# Altium project Gear Trak.PrjPcb
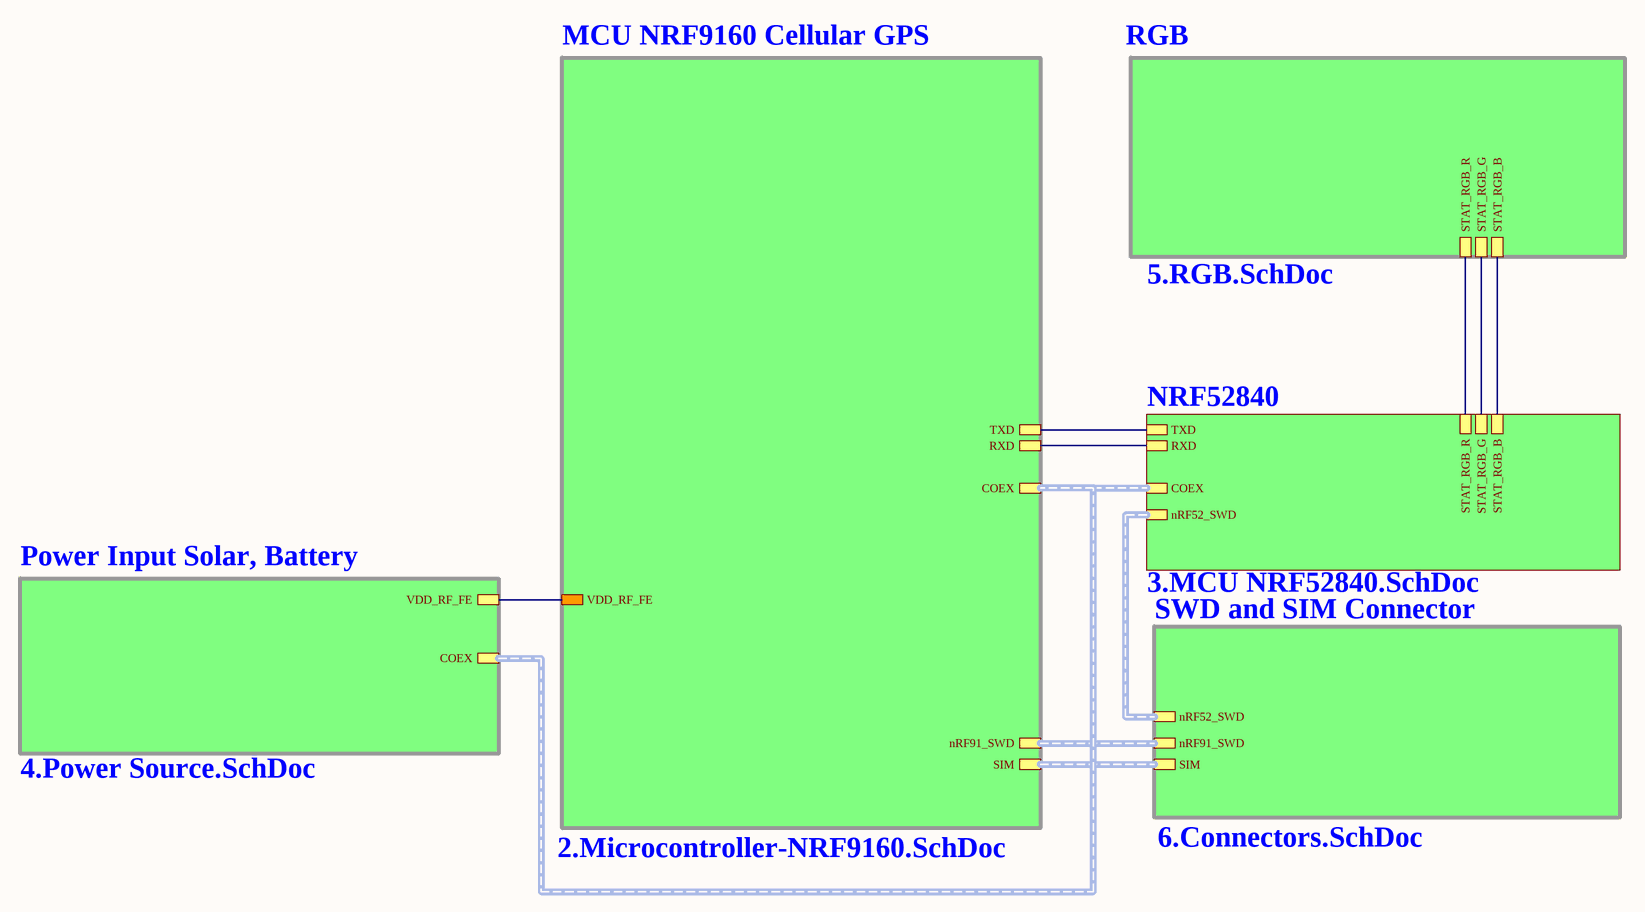
[diagram p0: 1.Block Diagram.SchDoc]
6 sheets, 130 parts. Net scope: hierarchical (ports join the sheet entries above them; power ports are global).
Board file: PCB.PcbDoc
Sheets:
  1.Block Diagram.SchDoc
    MCU NRF9160 Cellular GPS = 2.Microcontroller-NRF9160.SchDoc
    RGB = 5.RGB.SchDoc
    Power Input Solar, Battery = 4.Power Source.SchDoc
    SWD and SIM Connector = 6.Connectors.SchDoc
    NRF52840 = 3.MCU NRF52840.SchDoc

## Sheet 1.Block Diagram.SchDoc
size A3; DocumentNumber: 1; SheetNumber: 1

### Sub-sheets
MCU NRF9160 Cellular GPS = 2.Microcontroller-NRF9160.SchDoc: nRF91_SWD (harness SWD), SIM (harness SIM), VDD_RF_FE, COEX (harness COEX), TXD, RXD
NRF52840 = 3.MCU NRF52840.SchDoc: COEX (harness COEX), nRF52_SWD (harness SWD), STAT_RGB_R, STAT_RGB_G, STAT_RGB_B, TXD, RXD
Power Input Solar, Battery = 4.Power Source.SchDoc: COEX (harness COEX), VDD_RF_FE
RGB = 5.RGB.SchDoc: STAT_RGB_R, STAT_RGB_B, STAT_RGB_G
SWD and SIM Connector = 6.Connectors.SchDoc: SIM (harness SIM), nRF91_SWD (harness SWD), nRF52_SWD (harness SWD)

### Nets
RXD: sheet MCU NRF9160 Cellular GPS/RXD, sheet NRF52840/RXD
STAT_RGB_B: sheet RGB/STAT_RGB_B, sheet NRF52840/STAT_RGB_B
STAT_RGB_G: sheet RGB/STAT_RGB_G, sheet NRF52840/STAT_RGB_G
STAT_RGB_R: sheet RGB/STAT_RGB_R, sheet NRF52840/STAT_RGB_R
TXD: sheet MCU NRF9160 Cellular GPS/TXD, sheet NRF52840/TXD
VDD_RF_FE: sheet MCU NRF9160 Cellular GPS/VDD_RF_FE, sheet Power Input Solar, Battery/VDD_RF_FE

### Buses and harness runs
harness sheet MCU NRF9160 Cellular GPS/COEX = sheet NRF52840/COEX = sheet Power Input Solar, Battery/COEX
harness sheet MCU NRF9160 Cellular GPS/nRF91_SWD = sheet SWD and SIM Connector/nRF91_SWD
harness sheet MCU NRF9160 Cellular GPS/SIM = sheet SWD and SIM Connector/SIM
harness sheet NRF52840/nRF52_SWD = sheet SWD and SIM Connector/nRF52_SWD

## Sheet 2.Microcontroller-NRF9160.SchDoc
size A2; DocumentNumber: 2; SheetNumber: 2
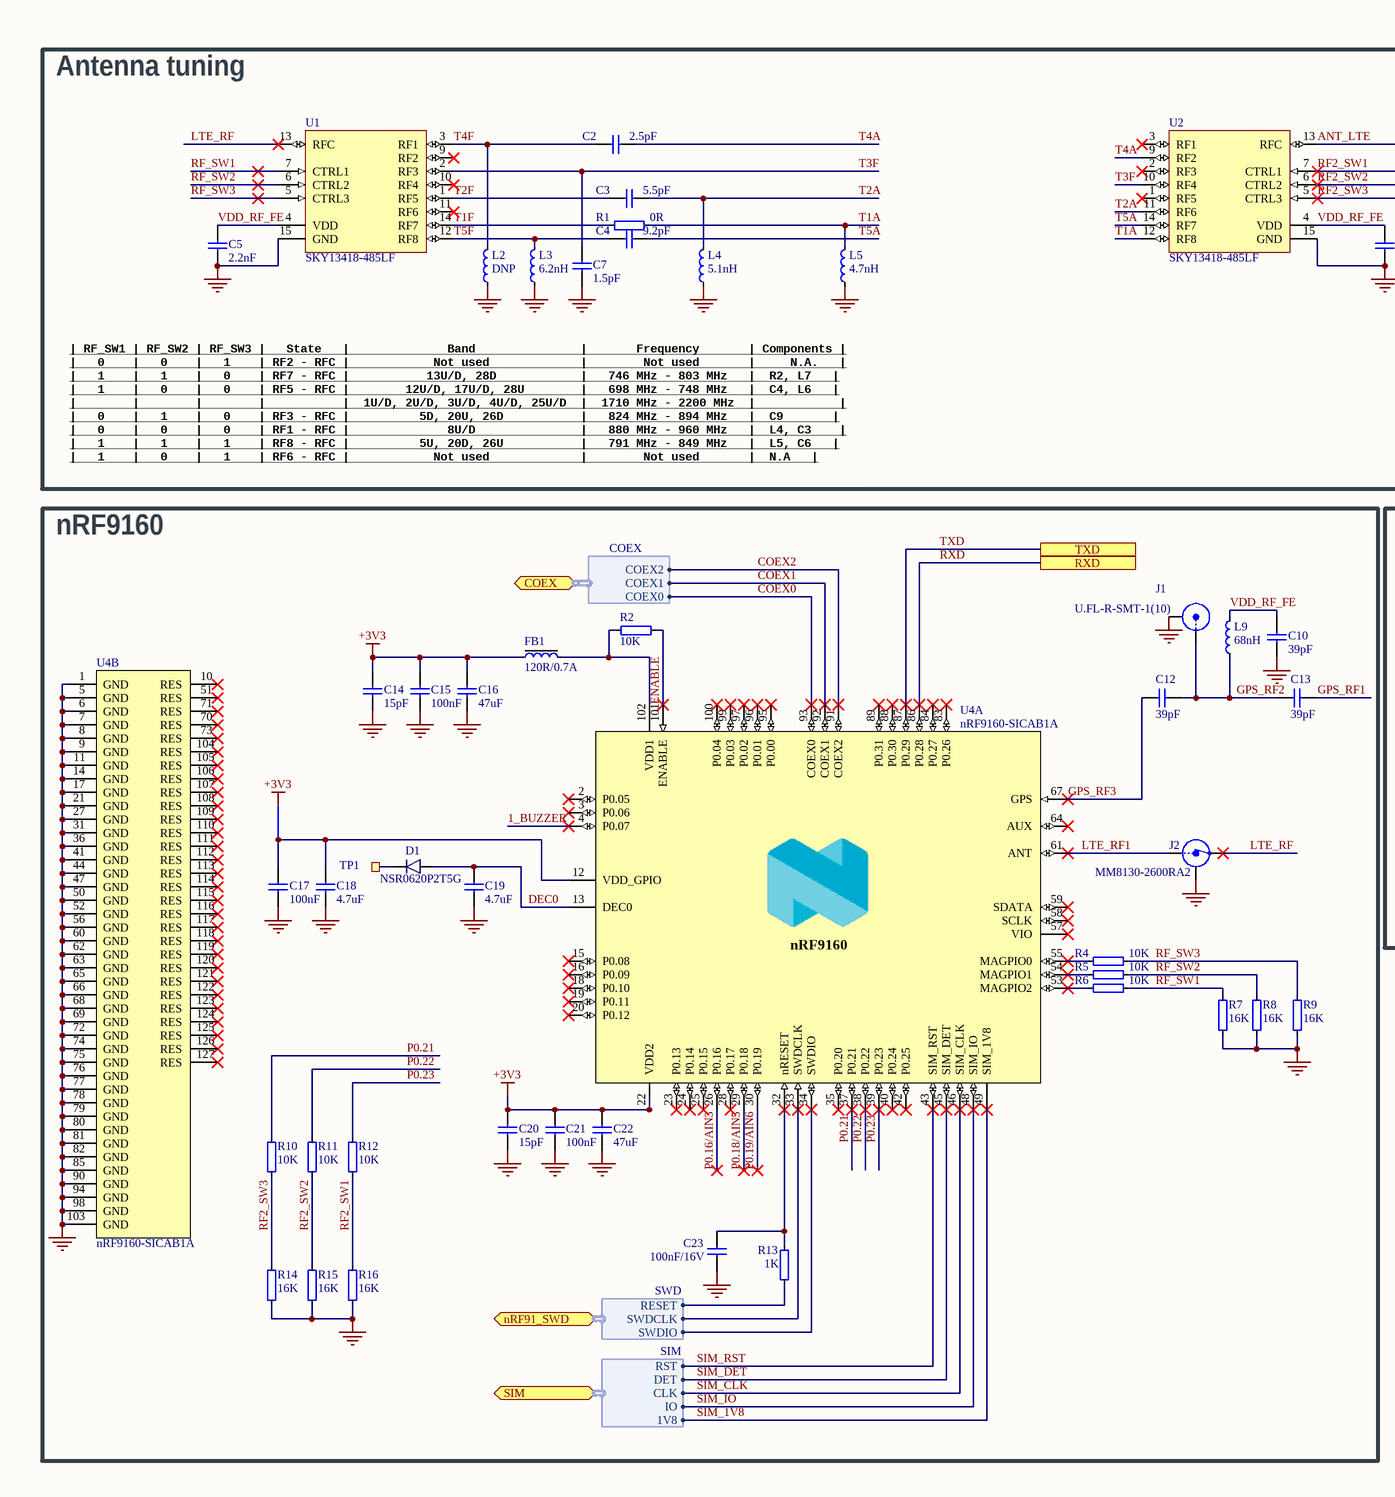
[diagram p1: 2.Microcontroller-NRF9160.SchDoc, left]
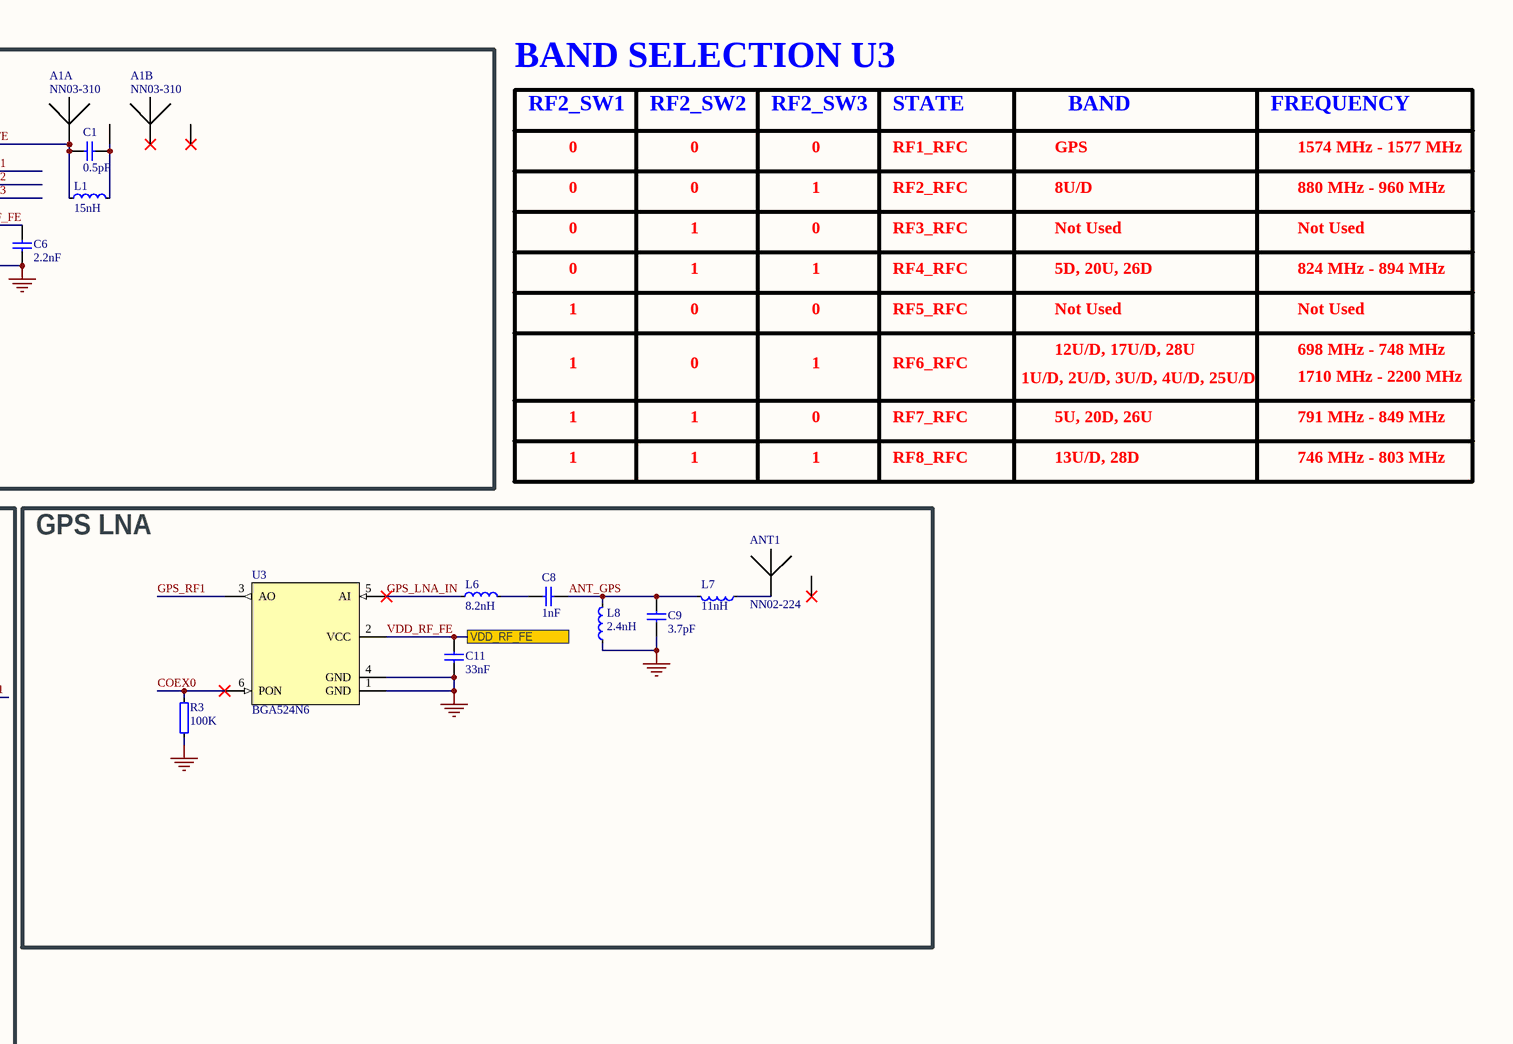
[diagram p2: 2.Microcontroller-NRF9160.SchDoc, right]

### Parts
A1  NN03-310  [FR01-S4-210_DF]  (parts A,B of 2)
ANT1  NN02-224  [ANT-NN02-224]
C1  0.5pF  [CAPC1005X04L]
C2  2.5pF  [CAPC0603X03L_C]
C3  5.5pF  [CAPC0603X03L_C]
C4  9.2pF  [CAPC0603X03L_C]
C5  2.2nF  [CAPC1005X04L]
C6  2.2nF  [CAPC1005X04L]
C7  1.5pF  [CAPC0603X03L_C]
C8  1nF  [CAPC1005X04L]
C9  3.7pF  [CAPC1005X04L]
C10  39pF  [CAPC1608X06L_3]
C11  33nF  [CAPC1005X04L]
C12  39pF  [CAPC1608X06L_3]
C13  39pF  [CAPC1608X06L_3]
C14  15pF  [CAPC1608X06L_3]
C15  100nF  [CAPC1608X06L_3]
C16  47uF  [CAPC2012X11L]
C17  100nF  [CAPC1608X06L_3]
C18  4.7uF  [CAPC1608X06L_3]
C19  4.7uF  [CAPC1608X06L_3]
C20  15pF  [CAPC1608X06L_3]
C21  100nF  [CAPC1608X06L_3]
C22  47uF  [CAPC2012X11L]
C23  100nF/16V  [CAPC1005X04L]
D1  NSR0620P2T5G  [SODFL100X40-2N]
FB1  120R/0.7A  [INDC1005X04L]
J1  U.FL-R-SMT-1(10)  [COAXIAL RF U.FL-R-SMT-1]
J2  MM8130-2600RA2  [COAXIAL-SWF]
L1  15nH  [INDC1608X06L_WW]
L2  DNP  [INDC0603X03L_C]
L3  6.2nH  [INDC0603X03L_C]
L4  5.1nH  [INDC0603X03L_C]
L5  4.7nH  [INDC0603X03L_C]
L6  8.2nH  [INDC1608X06L_WW]
L7  11nH  [INDC1608X06L]
L8  2.4nH  [INDC1005X04L_2]
L9  68nH  [INDC1005X04L_WW]
R1  0R  [RESC0603X03L_C]
R2  10K  [RESC1005X04L]
R3  100K  [RESC1005X04L]
R4  10K  [RESC1005X04L]
R5  10K  [RESC1005X04L]
R6  10K  [RESC1005X04L]
R7  16K  [RESC1005X04L]
R8  16K  [RESC1005X04L]
R9  16K  [RESC1005X04L]
R10  10K  [RESC1005X04L]
R11  10K  [RESC1005X04L]
R12  10K  [RESC1005X04L]
R13  1K  [RESC1005X04L]
R14  16K  [RESC1005X04L]
R15  16K  [RESC1005X04L]
R16  16K  [RESC1005X04L]
TP1  Ø1.0mm,SMD  [TP_SMD_Ø1.0mm]  (value not drawn)  (no BOM)
U1  SKY13418-485LF  [UFQFN40P200X200X65_HS-15N]
U2  SKY13418-485LF  [UFQFN40P200X200X65_HS-15N]
U3  BGA524N6  [XFDFN40P100X55-6N]
U4  nRF9160-SICAB1A  [LGA50P1600X1050X104-161N]  (parts A,B of 2)

### Blocks framed on the sheet
Antenna tuning: A1 C1-C7 L1-L5 R1 U1 U2
nRF9160: C10 C12-C23 D1 FB1 J1 J2 L9 R2 R4-R16 TP1 U4
GPS LNA: ANT1 C8 C9 C11 L6-L8 R3 U3

### Ports
COEX (bidir, harness COEX), nRF91_SWD (bidir, harness SWD), RXD, SIM (bidir, harness SIM), TXD, VDD_RF_FE

### Harnesses
SWD: SWDIO, SWDCLK, RESET
SIM: DET, RST, CLK, IO, 1V8
COEX: COEX2, COEX1, COEX0

### Nets
+3V3: C14.1 C15.1 C16.1 C17.1 C18.1 C20.1 C21.1 C22.1 FB1.1 U4.12(VDD_GPIO) U4.22(VDD2)
GND: C5.2 C6.2 C7.2 C9.2 C10.1 C11.1 C14.2 C15.2 C16.2 C17.2 C18.2 C19.2 C20.2 C21.2 C22.2 C23.2 J1.2(Y) J2.2(Shield) L2.1 L3.1 L4.1 L5.1 L8.1 R3.1 R7.1 R8.1 R9.1 R14.1 R15.1 R16.1 U1.15(GND) U2.15(GND) U3.1(GND) U3.4(GND) U4.1(GND) U4.5(GND) U4.6(GND) U4.7(GND) U4.8(GND) U4.9(GND) U4.11(GND) U4.14(GND) U4.17(GND) U4.21(GND) U4.27(GND) U4.31(GND) U4.36(GND) U4.41(GND) U4.44(GND) U4.47(GND) U4.50(GND) U4.52(GND) U4.56(GND) U4.60(GND) U4.62(GND) U4.63(GND) U4.65(GND) U4.66(GND) U4.68(GND) U4.69(GND) U4.72(GND) U4.74(GND) U4.75(GND) U4.76(GND) U4.77(GND) U4.78(GND) U4.79(GND) U4.80(GND) U4.81(GND) U4.82(GND) U4.85(GND) U4.90(GND) U4.94(GND) U4.98(GND) U4.103(GND)
1_BUZZER: U4.4(P0.07)
ANT_GPS: C8.2 C9.1 L7.2 L8.2
ANT_LTE: A1.1(Feed_A) C1.1 L1.1 U2.13(RFC)
COEX0: R3.2 U3.6(PON) U4.93(COEX0) ; port COEX.COEX0
COEX1: U4.92(COEX1) ; port COEX.COEX1
COEX2: U4.91(COEX2) ; port COEX.COEX2
DEC0: C19.1 D1.2(A) U4.13(DEC0)
ENABLE: R2.1 U4.101(ENABLE)
GPS_LNA_IN: L6.1 U3.5(AI)
GPS_RF1: C13.2 U3.3(AO)
GPS_RF2: C12.2 C13.1 J1.1(X) L9.2
GPS_RF3: C12.1 U4.67(GPS)
LTE_RF: J2.3(OUT) U1.13(RFC)
LTE_RF1: J2.1(IN) U4.61(ANT)
P0.16/AIN3: U4.26(P0.16)
P0.18/AIN5: U4.29(P0.18)
P0.19/AIN6: U4.30(P0.19)
P0.21: R10.2 U4.37(P0.21)
P0.22: R11.2 U4.38(P0.22)
P0.23: R12.2 U4.39(P0.23)
RF2_SW1: R12.1 R16.2 U2.7(CTRL1)
RF2_SW2: R11.1 R15.2 U2.6(CTRL2)
RF2_SW3: R10.1 R14.2 U2.5(CTRL3)
RF_SW1: R6.1 R7.2 U1.7(CTRL1)
RF_SW2: R5.1 R8.2 U1.6(CTRL2)
RF_SW3: R4.1 R9.2 U1.5(CTRL3)
RXD: U4.86(P0.28) ; port RXD
SIM_1V8: U4.49(SIM_1V8) ; port SIM.1V8
SIM_CLK: U4.46(SIM_CLK) ; port SIM.CLK
SIM_DET: U4.45(SIM_DET) ; port SIM.DET  [project net DETECT]
SIM_IO: U4.48(SIM_IO) ; port SIM.IO
SIM_RST: U4.43(SIM_RST) ; port SIM.RST
T1A: L5.2 R1.1 U2.12(RF8)
T1F: R1.2 U1.14(RF7)
T2A: C3.1 L4.2 U2.11(RF6)
T2F: C3.2 U1.1(RF5)
T3F: C7.1 U1.2(RF3) U2.10(RF4)
T4A: C2.1 U2.9(RF2)
T4F: C2.2 L2.2 U1.3(RF1)
T5A: C4.1 U2.14(RF7)
T5F: C4.2 L3.2 U1.12(RF8)
TXD: U4.87(P0.29) ; port TXD
VDD_RF_FE: C5.1 C6.1 C10.2 C11.2 L9.1 U1.4(VDD) U2.4(VDD) U3.2(VCC) ; port VDD_RF_FE
NetA1_2: A1.2(Tuning_A) C1.2 L1.2
NetANT1_1: ANT1.1(Feed_A) L7.1
NetC8_1: C8.1 L6.2
NetC23_1: C23.1 R13.2 U4.32(nRESET)
NetD1_1: D1.1(C) TP1.1
NetFB1_2: FB1.2 R2.2 U4.102(VDD1)
NetR4_2: R4.2 U4.55(MAGPIO0)
NetR5_2: R5.2 U4.54(MAGPIO1)
NetR6_2: R6.2 U4.53(MAGPIO2)
NetR13_1: R13.1 ; port nRF91_SWD.RESET
NetU4_33: U4.33(SWDCLK) ; port nRF91_SWD.SWDCLK
NetU4_34: U4.34(SWDIO) ; port nRF91_SWD.SWDIO

Not connected (* = marked no-connect by the designer): A1 3(Feed_B)* 4(Tuning_B)*; ANT1 2(NC)*; U1 8(NC) 9(RF2)* 10(RF4)* 11(RF6)*; U2 1(RF5)* 2(RF3)* 3(RF1)* 8(NC); U4 2(P0.05)* 3(P0.06)* 10(RES)* 15(P0.08)* 16(P0.09)* 18(P0.10)* 19(P0.11)* 20(P0.12)* 23(P0.13)* 24(P0.14)* 25(P0.15)* 28(P0.17)* 35(P0.20)* 40(P0.24)* 42(P0.25)* 51(RES)* 57(VIO)* 58(SCLK)* 59(SDATA)* 64(AUX)* 70(RES)* 71(RES)* 73(RES)* 83(P0.26)* 84(P0.27)* 88(P0.30)* 89(P0.31)* 95(P0.00)* 96(P0.01)* 97(P0.02)* 99(P0.03)* 100(P0.04)* 104(RES)* 105(RES)* 106(RES)* 107(RES)* 108(RES)* 109(RES)* 110(RES)* 111(RES)* 112(RES)* 113(RES)* 114(RES)* 115(RES)* 116(RES)* 117(RES)* 118(RES)* 119(RES)* 120(RES)* 121(RES)* 122(RES)* 123(RES)* 124(RES)* 125(RES)* 126(RES)* 127(RES)*

### Notes on the sheet
- BAND SELECTION U3
- RF2_SW1
- 0
- RF2_SW2
- RF2_SW3
- STATE
- RF1_RFC
- GPS
- BAND
- FREQUENCY
- 1574 MHz - 1577 MHz
- 1
- RF2_RFC
- 8U/D
- 880 MHz - 960 MHz
- RF3_RFC
- RF4_RFC
- Not Used
- 5D, 20U, 26D
- 824 MHz - 894 MHz
- RF5_RFC
- RF6_RFC
- RF7_RFC
- 1U/D, 2U/D, 3U/D, 4U/D, 25U/D
- 12U/D, 17U/D, 28U
- 5U, 20D, 26U
- 698 MHz - 748 MHz
- 1710 MHz - 2200 MHz
- 791 MHz - 849 MHz
- | RF_SW1 | RF_SW2 | RF_SW3 |   State   |              Band               |       Frequency       | Components |
  |   0    |   0    |   1    | RF2 - RFC |            Not used             |        Not used       |     N.A.   |
  |   1    |   1    |   0    | RF7 - RFC |           13U/D, 28D            |   746 MHz - 803 MHz   |  R2, L7   |
  |   1    |   0    |   0    | RF5 - RFC |        12U/D, 17U/D, 28U        |   698 MHz - 748 MHz   |  C4, L6   |
  |        |        |        |           |  1U/D, 2U/D, 3U/D, 4U/D, 25U/D  |  1710 MHz - 2200 MHz  |            |
  |   0    |   1    |   0    | RF3 - RFC |          5D, 20U, 26D           |   824 MHz - 894 MHz   |  C9       |
  |   0    |   0    |   0    | RF1 - RFC |              8U/D               |   880 MHz - 960 MHz   |  L4, C3    |
  |   1    |   1    |   1    | RF8 - RFC |          5U, 20D, 26U           |   791 MHz - 849 MHz   |  L5, C6   |
  |   1    |   0    |   1    | RF6 - RFC |            Not used             |        Not used       |  N.A   |
- RF8_RFC
- 13U/D, 28D
- 746 MHz - 803 MHz
- (in symbol nRF9160-SICAB1A, part A) nRF9160

### Library data of the parts
A1 = FR01-S4-210-D: Mobile IoT LTE Multi-Band Antenna; ComponentLink1URL: https://www.fractusantennas.com/wp-content/uploads/2018/01/DS_FR01-S4-210.pdf; ComponentLink1Description: Datasheet; ComponentLink2URL: https://www.fractusantennas.com/trio-mxtend-mobile-iot-antenna/; ComponentLink2Description: Supplier link; Digikey Part Number: 2115-NN03-310CT-ND; LCSC: Non Stock
C1 = C0402-0.5p-HQ-Murata: Capacitor, NP0, ±0.05pF, 50V; ComponentLink1URL: https://search.murata.co.jp/Ceramy/image/img/A01X/G101/ENG/GJM1555C1HR50WB01-01.pdf; ComponentLink1Description: Datasheet; ComponentLink2URL: N.A.; ComponentLink2Description: Supplier link; Package: 0402; LCSC: C76912
C2-C4 C7 = C0201-5.5p-HQ-Murata: Capacitor, NP0, ±0.05pF, 25V; ComponentLink1URL: N.A.; ComponentLink1Description: Datasheet; ComponentLink2URL: N.A.; ComponentLink2Description: Supplier link; Package: 0201
  C2: LCSC: C161422
  C3: LCSC: C2187712
  C4: LCSC: C3019008
  C7: LCSC: C565475
C5 C6 C8 C9 C11 C14 C15 C17-C21 C23 = C0201-15p: Capacitor, NP0, ±5%, 25V; ComponentLink1URL: N.A.; ComponentLink1Description: Datasheet; ComponentLink2URL: N.A.; ComponentLink2Description: Supplier link
  C5 C6: Package: 0402; LCSC: C576456
  C8: Package: 0402; LCSC: C524559
  C9: Package: 0402; LCSC: C1855290; Digikey Part Number: 490-GJM1555C1H3R7BB01DCT-ND
  C11: Package: 0402; LCSC: C301939
  C14 C20: Package: 0603; LCSC: C519451
  C15 C17 C21: Package: 0603; LCSC: C14663
  C18 C19: Package: 0603; LCSC: C2961288
  C23: Package: 0402; LCSC: C1525
C10 C12 C13 = C0201-39p: Capacitor, NP0, ±1%, 25V; ComponentLink1URL: N.A.; ComponentLink1Description: Datasheet; ComponentLink2URL: N.A.; ComponentLink2Description: Supplier link; Package: 0201; LCSC: C3034511
C16 C22 = C0805-47µ-10V: Capacitor, X5R, ±20%, 10V; ComponentLink1URL: https://search.murata.co.jp/Ceramy/image/img/A01X/G101/ENG/GRM21BR61A476ME15-01A.pdf; ComponentLink1Description: Datasheet; ComponentLink2URL: N.A.; ComponentLink2Description: Supplier link; LCSC: C124129; Package: 0805
D1 = NSR0620P2T5G: 20V schottky barrier diode, Vf 350 mV @ 100 mA, Ir 2.0 µA @ 10 V, If 500 mA; Manufacturer: ON Semiconductor; Part number IPS: 00000009952; Note: N.A.; Artikkelnr Noca: 10029169; Pad Count: 2; Part Number: NSR0620P2T5G; Manufacturer Part Number: NSR0620P2T5G; LatestRevisionDate: 2016-07-07; Published: 2016-07-07; Value: NSR0620P2T5G; Package: SOD-923; ComponentLink1URL: N.A.; ComponentLink1Description: Datasheet; ComponentLink2URL: N.A.; ComponentLink2Description: Supplier link; HelpURL: http://www.onsemi.com/pub_link/Collateral/NSR0620P2-D.PDF; Supplier 1: Digi-Key; Supplier Part Number 1: NSR0620P2T5GOSCT-ND; Supplier 2: N.A.; Supplier Part Number 2: N.A.; Component Class: Semiconductors; PartId: 101300131; LCSC: C91106
FB1 = FB0402-120R@100M-700mA: Ferrite Bead, 120 Ohm @ 100MHz, 700mA, 130 mOhm Max; Manufacturer: Murata; Manufacturer Part Number: BLM15AX121SN1; Part number IPS: 00000004487; Note: N.A.; Pad Count: 2; Part Number: FB0402-120R@100M-700mA; ComponentLink1URL: https://www.murata.com/en-us/products/productdata/8796740059166/ENFA0018.pdf; ComponentLink1Description: Datasheet; ComponentLink2URL: N.A.; ComponentLink2Description: Supplier link; HelpURL: https://www.murata.com/products/productdetail?partno=BLM15AX121SN1%23; Package: 0402; LatestRevisionDate: 2020-04-28; Published: 2020-04-28; Value: 120R/0.7A; Artikkelnr Noca: N.A.; Supplier 1: Digi-Key; Supplier Part Number 1: 490-5439-1-ND; Supplier 2: N.A.; Supplier Part Number 2: N.A.; Component Class: Inductors; PartId: 100300100; LCSC: C337873
J1 = 20279-001E-03: Ultraminiature Coaxial Connector, 50 Ohm, SMD; ComponentLink1URL: \\hizz\pro\app9717\Datasheet\connectors\Wellshow\20279C18.pdf; ComponentLink1Description: Datasheet; ComponentLink2URL: N.A.; ComponentLink2Description: Supplier link; LCSC: NILL; Digikey Part Number: H11891CT-ND
J2 = MM8130-2600: Coaxial Connector with Switch; ComponentLink1URL: N.A.; ComponentLink1Description: Datasheet; ComponentLink2URL: N.A.; ComponentLink2Description: Supplier link; LCSC: C167503
L1 = L0603-15n-Wirewound-Murata: Inductor, 700mA, ±5%, 85mΩ, Q=42 @ 250MHz; ComponentLink1URL: https://search.murata.co.jp/Ceramy/image/img/P02/JELF243A-0026.pdf; ComponentLink1Description: Datasheet; ComponentLink2Description: Supplier link; Package: 0603; ComponentLink2URL: N.A.; LCSC: C341693
L2-L5 L7 L8 = L0201-6n2-Wirewound-Murata: Inductor, 360mA, ±5%, 220mOhm, Q=39; ComponentLink1URL: https://search.murata.co.jp/Ceramy/image/img/P02/JELF243A-0109.pdf; ComponentLink1Description: Datasheet; ComponentLink2Description: Supplier link; ComponentLink2URL: N.A.
  L2: Package: 0201; LCSC: NILL
  L3: Package: 0201; LCSC: C142508
  L4: Package: 0201; LCSC: C162624
  L5: Package: 0201; LCSC: C237443
  L7: Package: 0603; Digikey Part Number: 490-LQW18AN11NG80DCT-ND; LCSC: Non Stock
  L8: Package: 0402; LCSC: C412266
L6 = L0603-8n2-Wirewound-Murata: Inductor, 800mA, ±0.5nH, 58mΩ, Q=38 @ 250MHz; Manufacturer: Murata; Manufacturer Part Number: LQW18AN8N2D10; Part number IPS: 00000003972; Note: -55°C ~ 125°C; Artikkelnr Noca: N.A.; Pad Count: 2; Part Number: L0603-8n2-Wirewound-Murata; ComponentLink1URL: https://search.murata.co.jp/Ceramy/image/img/P02/JELF243A-0026.pdf; ComponentLink1Description: Datasheet; ComponentLink2Description: Supplier link; HelpURL: https://psearch.en.murata.com/inductor/product/LQW18AN8N2D10%23.html; Package: 0603; LatestRevisionDate: 2019-10-25; Published: 2019-10-25; Value: 8.2nH; ComponentLink2URL: N.A.; Supplier 1: Digi-Key; Supplier Part Number 1: 490-6914-1-ND; Supplier 2: N.A.; Supplier Part Number 2: N.A.; Component Class: Inductors; PartId: 100300394; LCSC: C98087
L9 = L0402-68n-Wirewound-Murata: Inductor, 140mA, ±2%, 1960mΩ, Q=20; ComponentLink1URL: https://search.murata.co.jp/Ceramy/image/img/P02/JELF243A-0050.pdf; ComponentLink1Description: Datasheet; ComponentLink2URL: N.A.; ComponentLink2Description: Supplier link; LCSC: C108965; Package: 0402
R1 = R0201-0R: Resistor, ±5%, 0.05W; ComponentLink1URL: N.A.; ComponentLink1Description: Datasheet; ComponentLink2URL: N.A.; ComponentLink2Description: Supplier link; Package: 0201; LCSC: C716999
R2-R16 = R0201-10k: Resistor, ±1%, 0.05W; ComponentLink1URL: N.A.; ComponentLink1Description: Datasheet; ComponentLink2URL: N.A.; ComponentLink2Description: Supplier link; Package: 0402
  R2 R4-R6 R10-R12: LCSC: C25744
  R3: LCSC: C25741
  R7-R9 R14-R16: LCSC: C160493
  R13: LCSC: C11702
TP1 = TP_SMD_Ø1.0MM: 1.0mm circular SMD testpad; Manufacturer: Nordic Semiconductor; Manufacturer Part Number: N.A.; Pad Count: 1; Part Number: TP_SMD_Ø1.0MM; Footprint Doc: TP_SMD_Ø1.0mm; LatestRevisionDate: 2013-06-11; Published: 2013-06-11; Value: Ø1.0mm,SMD; Note: N.A.; Artikkelnr Noca: N.A.; Part number IPS: N.A.; ComponentLink1URL: N.A.; ComponentLink1Description: Datasheet; ComponentLink2URL: N.A.; ComponentLink2Description: Supplier link; HelpURL: N.A.; Supplier 1: N.A.; Supplier Part Number 1: N.A.; Supplier 2: N.A.; Supplier Part Number 2: N.A.; Component Class: Connectors; PartId: 100500475
U1 U2 = QM12038: SP8T Switch For 3G/4G Applications; ComponentLink1URL: \\hizz\pro\app9717\Datasheet\integated circuits\qorvo\QM12038 Datasheet.pdf; ComponentLink1Description: Datasheet; ComponentLink2Description: Supplier link; LCSC: C150871; Package: QFN-14; ComponentLink2URL: N.A.
U3 = BGA524N6E6327XTSA1: GPS/GNSS Low-Noise Amplifier, 19.6dB Gain, 0.55dB Noise Figure, 1.5V to 3.3V Supply Range; Manufacturer: Infineon Technologies; Part number IPS: 00000004011; Note: N.A.; Pad Count: 6; Manufacturer Part Number: BGA524N6E6327XTSA1; Package: XFDFN-6; Value: BGA524N6; ComponentLink1URL: https://www.infineon.com/dgdl/Infineon-BGA524N6-DS-v03_00-en.pdf?fileId=db3a304344e406b50144e44dfad302b9; ComponentLink1Description: Datasheet; ComponentLink2URL: N.A.; ComponentLink2Description: Supplier link; HelpURL: https://www.infineon.com/cms/en/product/rf-wireless-control/low-noise-amplifier-lna-ics/gps-glonass-compass-lna/bga524n6/; LatestRevisionDate: 2019-10-25; Published: 2019-10-25; Supplier Part Number 1: BGA524N6E6327XTSA1CT-ND; Supplier Part Number 2: 726-A524N6E6327XTSA1; Component Class: Misc_ICs; PartId: 101900596; Digikey Part Number: BGA524N6E6327XTSA1CT-ND; LCSC: C534158
U4 = nRF9160-SICAB1A: Low power System-in-Package with integrated LTE-M/NB-IoT modem and GPS; Manufacturer: Nordic Semiconductor; Part number IPS: 80000002329; Note: N.A.; Pad Count: 161; Part Number: nRF9160-SICAB1A; Manufacturer Part Number: nRF9160-SICAB1A; Footprint Doc: LGA-161; Value: nRF9160-SICAB1A; ComponentLink1URL: N.A.; ComponentLink1Description: Datasheet; ComponentLink2URL: N.A.; ComponentLink2Description: Supplier link; HelpURL: N.A.; LatestRevisionDate: 2020-08-13; Published: 2020-08-13; Supplier 1: Nordic Semiconductor; Supplier Part Number 1: nRF9160-SICAB1A; Supplier 2: N.A.; Supplier Part Number 2: N.A.; Artikkelnr Noca: N.A.; Component Class: nRF_Devices; PartId: 102000165; Digikey Part Number: 4823-NRF9160-SICA-B1A-RCT-ND; LCSC: NILL
ANT1 = NN02-224: Digikey Part Number: 2115-NN02-224CT-ND; LCSC: Non Stock

## Sheet 5.RGB.SchDoc
size A4; DocumentNumber: 5; SheetNumber: 5
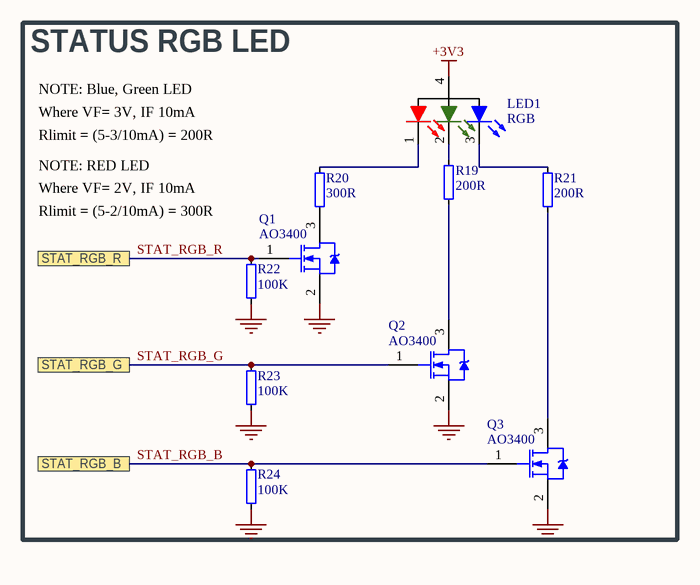
[diagram p3: 5.RGB.SchDoc]

### Parts
LED1  RGB  [LED_RGB_0606]
Q1  AO3400  [SOT-23a]
Q2  AO3400  [SOT-23a]
Q3  AO3400  [SOT-23a]
R19  200R  [RESC1005X04L]
R20  300R  [RESC1005X04L]
R21  200R  [RESC1005X04L]
R22  100K  [RESC1005X04L]
R23  100K  [RESC1005X04L]
R24  100K  [RESC1005X04L]

### Ports
STAT_RGB_B, STAT_RGB_G, STAT_RGB_R

### Nets
+3V3: LED1.4(+)
GND: Q1.2(S) Q2.2(S) Q3.2(S) R22.1 R23.1 R24.1
STAT_RGB_B: Q3.1(G) R24.2 ; port STAT_RGB_B
STAT_RGB_G: Q2.1(G) R23.2 ; port STAT_RGB_G
STAT_RGB_R: Q1.1(G) R22.2 ; port STAT_RGB_R
NetLED1_1: LED1.1(R-) R20.2
NetLED1_2: LED1.2(G-) R19.2
NetLED1_3: LED1.3(B-) R21.2
NetQ1_3: Q1.3(D) R20.1
NetQ2_3: Q2.3(D) R19.1
NetQ3_3: Q3.3(D) R21.1

### Notes on the sheet
- STATUS RGB LED
- NOTE: Blue, Green LED
- Where VF= 3V, IF 10mA
- Rlimit = (5-3/10mA) = 200R
- NOTE: RED LED
- Where VF= 2V, IF 10mA
- Rlimit = (5-2/10mA) = 300R

### Library data of the parts
LED1 = LTST-C19HE1WT: LCSC: C458749
Q1-Q3 = NMOS-2: 30V 5.8A 35mΩ@10V,5.8A 350mW N Channel SOT-23 MOSFETs ROHS; LCSC: C181090; ComponentLink1Description: Manufacturer Link; ComponentLink1URL: http://www.irf.com/
R19-R24 = R0201-10k: Resistor, ±1%, 0.05W; ComponentLink1URL: N.A.; ComponentLink1Description: Datasheet; ComponentLink2URL: N.A.; ComponentLink2Description: Supplier link; Package: 0402
  R19 R21: LCSC: C25087
  R20: LCSC: C25102
  R22-R24: LCSC: C25741

## Sheet 4.Power Source.SchDoc
size A4; DocumentNumber: 4; SheetNumber: 4
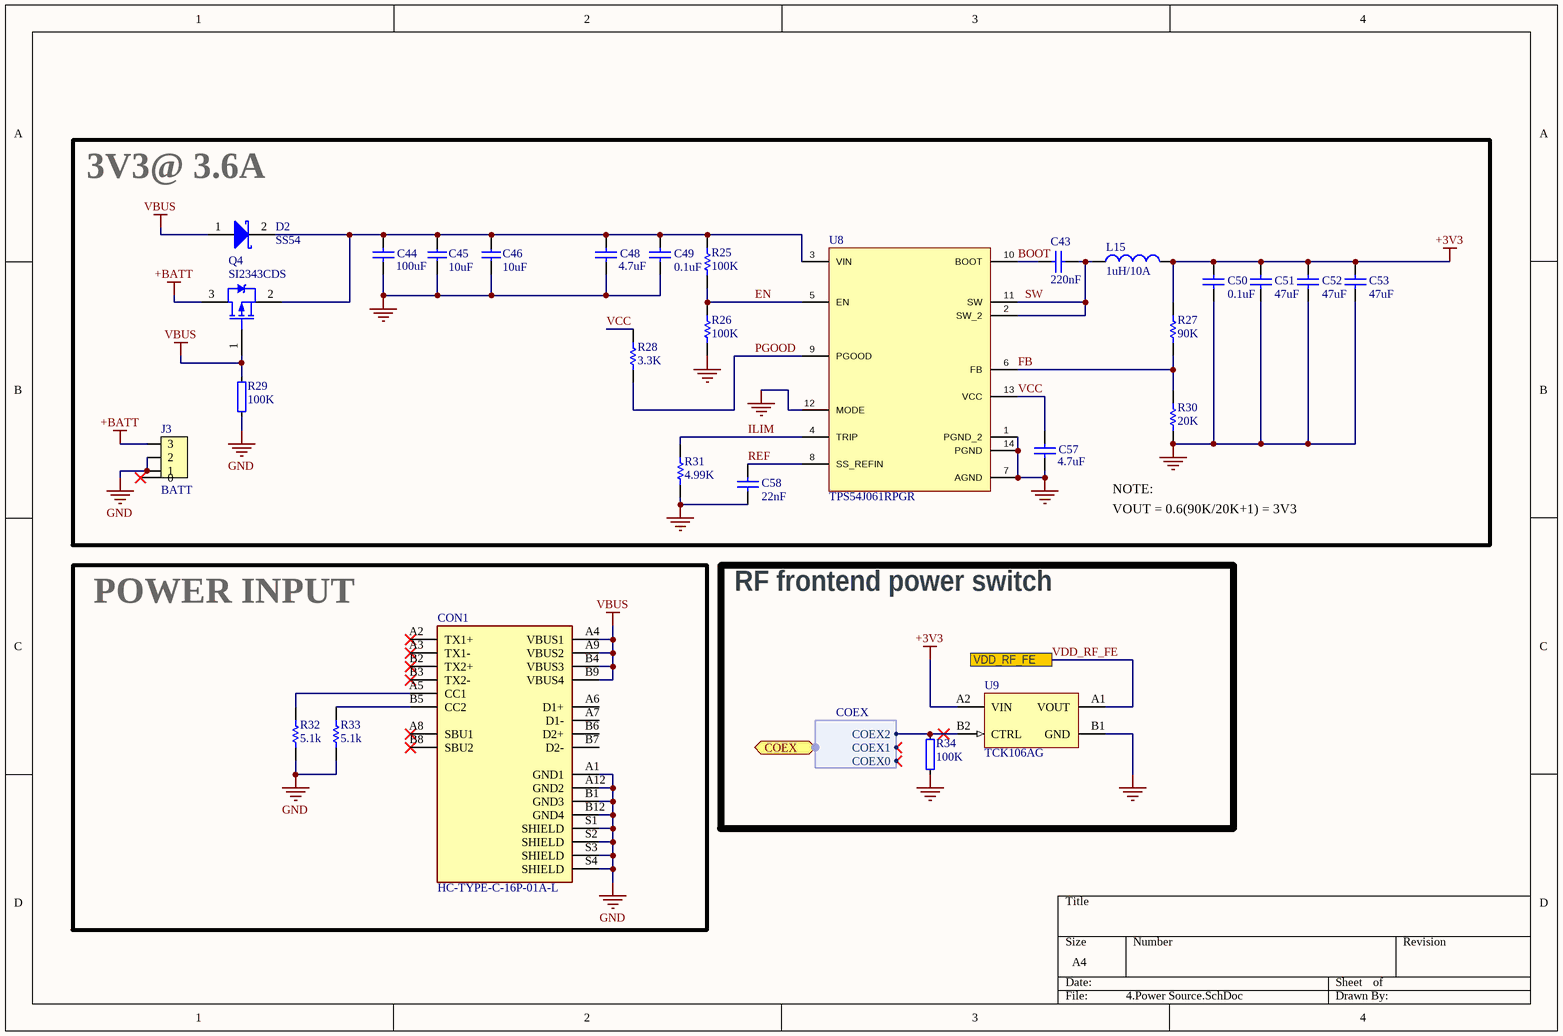
[diagram p4: 4.Power Source.SchDoc]

### Parts
C43  220nF  [CAPC1608X06L_3]
C44  100uF  [CAPC3225CX04L]
C45  10uF  [CAPC1608X06L_3]
C46  10uF  [CAPC1608X06L_3]
C48  4.7uF  [CAPC1608X06L_3]
C49  0.1uF  [CAPC1608X06L_3]
C50  0.1uF  [CAPC1608X06L_3]
C51  47uF  [CAPC2012X11L]
C52  47uF  [CAPC2012X11L]
C53  47uF  [CAPC2012X11L]
C57  4.7uF  [CAPC1608X06L_3]
C58  22nF  [CAPC1608X06L_3]
CON1  HC-TYPE-C-16P-01A-L  [CONN_RCP_USB3.1_TYPE-C_16P_SMD_BLUE-HC-TYPE-C-16P-01A-L]
D2  SS54  [DO-214AC(SMA)]
J3  BATT  [CONN_SMD_3P_1mm_SM03B-SRSS-TB]
L15  1uH/10A  [IND_SMD_5.5X5.9MM]
Q4  SI2343CDS  [SOT-23a]
R25  100K  [RESC1608X03L_C_2]
R26  100K  [RESC1608X03L_C_2]
R27  90K  [RESC2012X11L]
R28  3.3K  [RESC1608X03L_C_2]
R29  100K  [RESC1005X04L]
R30  20K  [RESC2012X11L]
R31  4.99K  [RESC1608X03L_C_2]
R32  5.1k  [RESC1608X03L_C_2]
R33  5.1k  [RESC1608X03L_C_2]
R34  100K  [RESC1005X04L]
U8  TPS54J061RPGR  [VQFN-14_2MMX3MM]
U9  TCK106AG  [BGA4C40P2X2_76X76X62]

### Blocks framed on the sheet
3V3@ 3.6A: C43-C46 C48-C53 C57 C58 D2 J3 L15 Q4 R25-R31 U8
POWER INPUT: CON1 R32 R33
RF frontend power switch: R34 U9

### Ports
COEX (bidir, harness COEX), VDD_RF_FE

### Harnesses
COEX: COEX2, COEX1, COEX0

### Nets
+3V3: C50.2 C51.2 C52.2 C53.2 L15.2 R27.2 U9.A2(VIN)
+BATT: J3.3 Q4.3(D)
GND: C44.1 C45.2 C46.2 C48.1 C49.1 C50.1 C51.1 C52.1 C53.1 C57.1 C58.1 CON1.A1(GND1) CON1.A12(GND2) CON1.B1(GND3) CON1.B12(GND4) CON1.S1(SHIELD) CON1.S2(SHIELD) CON1.S3(SHIELD) CON1.S4(SHIELD) J3.1 J3.2 R26.1 R29.1 R30.1 R31.1 R32.2 R33.2 R34.1 U8.1(PGND_2) U8.7(AGND) U8.12(MODE) U8.14(PGND) U9.B1(GND)
VBUS: CON1.A4(VBUS1) CON1.A9(VBUS2) CON1.B4(VBUS3) CON1.B9(VBUS4) D2.1(A) Q4.1(G) R29.2
BOOT: C43.1 U8.10(BOOT)
COEX2: R34.2 U9.B2(CTRL) ; port COEX.COEX2
EN: R25.1 R26.2 U8.5(EN)
FB: R27.1 R30.2 U8.6(FB)
ILIM: R31.2 U8.4(TRIP)
PGOOD: R28.1 U8.9(PGOOD)
REF: C58.2 U8.8(SS_REFIN)
SW: C43.2 L15.1 U8.2(SW_2) U8.11(SW)
VCC: C57.2 R28.2 U8.13(VCC)
VDD_RF_FE: U9.A1(VOUT) ; port VDD_RF_FE
NetC44_2: C44.2 C45.1 C46.1 C48.2 C49.2 D2.2(K) Q4.2(S) R25.2 U8.3(VIN)
NetCON1_A5: CON1.A5(CC1) R32.1
NetCON1_B5: CON1.B5(CC2) R33.1

Not connected (* = marked no-connect by the designer): CON1 A2(TX1+)* A3(TX1-)* A6(D1+) A7(D1-) A8(SBU1)* B2(TX2+)* B3(TX2-)* B6(D2+) B7(D2-) B8(SBU2)*; J3 0*

### Notes on the sheet
- NOTE:
- VOUT = 0.6(90K/20K+1) = 3V3

### Library data of the parts
C43 C44 C48-C53 C57 C58 = Cap: Capacitor
  C43: LCSC: C21120; Package: 0603
  C44: LCSC: C394395; Package: 1210
  C48 C57: LCSC: C109456; Package: 0603
  C49 C50: LCSC: C129621; Package: 0603
  C51-C53: LCSC: C16780; Package: 0805
  C58: LCSC: C21122; Package: 0603
C45 C46 = C0201-15p: Capacitor, NP0, ±5%, 25V; ComponentLink1URL: N.A.; ComponentLink1Description: Datasheet; ComponentLink2URL: N.A.; ComponentLink2Description: Supplier link; Package: 0603; LCSC: C386081
CON1 = HC-TYPE-C-16P-01A-L: 3A USB 3.1 1 260℃ Surface Mount 16 Female -40℃~+85℃ Gold plating High Conductivity Copper Type-C SMD USB Connectors ROHS; LCSC: C2997432
D2 = D Schottky: Schottky Diode; LCSC: C22452
J3 = SM03B-SRSS-TB: 1.0mm pitch connector side entry SMD; ComponentLink1URL: N.A.; ComponentLink1Description: Datasheet; ComponentLink2URL: N.A.; ComponentLink2Description: Supplier link; LCSC: C160403
L15 = Inductor: 3.3A 3.3uH ±20% 3.3A SMD,5.2x5.8x4.5mm Power Inductors ROHS /; Footprint: SMD,5.5x5.9mm; LCSC: C2903681
Q4 = PMOS-2: P-Channel Power MOSFET; LCSC: C6903; ComponentLink1Description: Manufacturer Link; ComponentLink1URL: http://www.irf.com/
R25-R28 R30-R33 = Res1: Resistor
  R25 R26: LCSC: C103211; Package: 0603
  R27: LCSC: C5123603; Package: 0805
  R28: LCSC: C22978; Package: 0603
  R30: LCSC: C4328; Package: 0805
  R31: LCSC: C23046; Package: 0603
  R32 R33: LCSC: C144111
R29 R34 = R0201-10k: Resistor, ±1%, 0.05W; ComponentLink1URL: N.A.; ComponentLink1Description: Datasheet; ComponentLink2URL: N.A.; ComponentLink2Description: Supplier link; LCSC: C25741; Package: 0402
U9 = TCK106AG: 1.0 A Load Switch IC with Slew Rate Control Driver in Ultra Small Package; Manufacturer: Toshiba; Manufacturer Part Number: TCK106AG,LF; Part number IPS: 00000004390; Pad Count: 4; Note: N.A.; Part Number: TCK106AG; PartId: 101900575; Component Class: Misc_ICs; ComponentLink1URL: https://toshiba.semicon-storage.com/info/docget.jsp?did=30131&prodName=TCK106AG; ComponentLink1Description: Datasheet; ComponentLink2URL: N.A.; ComponentLink2Description: Supplier link; HelpURL: N.A.; Footprint Doc: WLCSP-4; LatestRevisionDate: 2019-03-01; Published: 2019-02-17; Value: TCK106AG; Supplier 1: Digi-Key; Supplier Part Number 1: TCK106AGLFTR-ND; Supplier 2: Mouser; Supplier Part Number 2: 757-TCK106AGLF; Artikkelnr Noca: N.A.; LCSC: C146305
U8 = TPS54J061RPGR: LCSC: C2873462

## Sheet 6.Connectors.SchDoc
size A4; DocumentNumber: 6; SheetNumber: 6
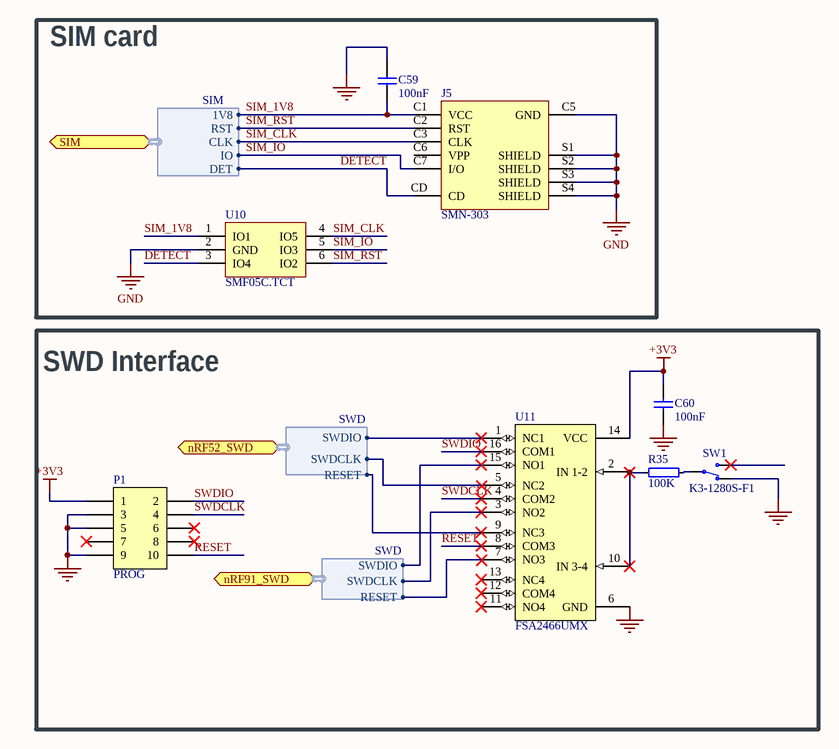
[diagram p5: 6.Connectors.SchDoc]

### Parts
C59  100nF  [CAPC1608X06L_3]
C60  100nF  [CAPC1608X06L_3]
J5  SMN-303  [XUNPU_SMN-303]
P1  PROG  [Header_SMT_2X5-1.27mm]
R35  100K  [RESC1005X04L]
SW1  K3-1280S-F1  [K3-1280S-F1]
U10  SMF05C.TCT  [SOT65P210X110-6N]
U11  FSA2466UMX  [XQFN40P180X260X50-16N]

### Blocks framed on the sheet
SIM card: C59 J5 U10
SWD Interface: C60 P1 R35 SW1 U11

### Ports
nRF52_SWD (bidir, harness SWD), nRF91_SWD (bidir, harness SWD), SIM (bidir, harness SIM)

### Harnesses
SIM: DET, RST, CLK, IO, 1V8
SWD: SWDIO, SWDCLK, RESET

### Nets
+3V3: C60.1 P1.1 U11.14(VCC)
GND: C59.1 C60.2 J5.C5(GND) J5.S1(SHIELD) J5.S2(SHIELD) J5.S3(SHIELD) J5.S4(SHIELD) P1.3 P1.5 P1.9 SW1.1(N.C) U10.2(GND) U11.6(GND)
DETECT: J5.CD U10.3(IO4) ; port SIM.DET
nRF52_RST: U11.9(NC3) ; port nRF52_SWD.RESET
nRF52_SWDCLK: U11.5(NC2) ; port nRF52_SWD.SWDCLK
nRF52_SWDIO: U11.1(NC1) ; port nRF52_SWD.SWDIO
RESET: P1.10 U11.8(COM3)
SIM_1V8: C59.2 J5.C1(VCC) U10.1(IO1) ; port SIM.1V8
SIM_CLK: J5.C3(CLK) U10.4(IO5) ; port SIM.CLK
SIM_IO: J5.C7(I/O) U10.5(IO3) ; port SIM.IO
SIM_RST: J5.C2(RST) U10.6(IO2) ; port SIM.RST
SWDCLK: P1.4 U11.4(COM2)
SWDIO: P1.2 U11.16(COM1)
NetR13_1: U11.7(NO3) ; port nRF91_SWD.RESET
NetR35_1: R35.1 SW1.2(COM)
NetR35_2: R35.2 U11.2(IN_1-2) U11.10(IN_3-4)
NetU4_33: U11.3(NO2) ; port nRF91_SWD.SWDCLK
NetU4_34: U11.15(NO1) ; port nRF91_SWD.SWDIO

Not connected (* = marked no-connect by the designer): J5 C6(VPP); P1 6* 7* 8*; SW1 3(N.O)*; U11 11(NO4)* 12(COM4)* 13(NC4)*

### Library data of the parts
C59 C60 = C0201-15p: Capacitor, NP0, ±5%, 25V; ComponentLink1URL: N.A.; ComponentLink1Description: Datasheet; ComponentLink2URL: N.A.; ComponentLink2Description: Supplier link; Package: 0603; LCSC: C14663
J5 = SMN-303: NanoSIM SMD SIM Card Connectors; Manufacturer: XUNPU; Alternate Part Number: SIM8066-6-1-14-01-A; Manufacturer Part Number: SMN-303; Supplier 1: LCSC; LCSC: C266888
P1 = Pin Header 2x5 SMD, 1.27mm, Angled: Pin Header 2x5, 1.27mm (50mil); Manufacturer: W-CON; Manufacturer Part Number: 1325B-1205S0Z080CR02; Part number IPS: 00000007800; Note: N.A.; Pad Count: 10; Part Number: Pin Header 2x5 SMD, 1.27mm, Angled; LatestRevisionDate: 2019-11-20; Published: 2014-01-22; Value: Pin Header 2x5; Artikkelnr Noca: N.A.; Footprint Doc: HDR_2x5-SMD-1.27mm-ANG; ComponentLink1URL: N.A.; ComponentLink1Description: Datasheet; ComponentLink2URL: N.A.; ComponentLink2Description: Supplier link; HelpURL: \\hizz\pro\app9717\Datasheet\connectors\W-CON\1325B-12XXXXZXXXCXXX.pdf; Supplier 1: Cabcon; Supplier Part Number 1: 1325B-1205S0Z080CR02; Supplier 2: Samtec; Supplier Part Number 2: FTSH-105-01-L-DH-A-C-TR; Component Class: Connectors; PartId: 100500257; LCSC: C5160761
R35 = R0201-10k: Resistor, ±1%, 0.05W; ComponentLink1URL: N.A.; ComponentLink1Description: Datasheet; ComponentLink2URL: N.A.; ComponentLink2Description: Supplier link; LCSC: C25741; Package: 0402
SW1 = AYZ0102AGRLC: Miniature slide switch, SPDT, Right-Angle, ON-ON, 12V, 100mA; ComponentLink1URL: https://www.ckswitches.com/media/1431/ayz.pdf; ComponentLink1Description: Datasheet; ComponentLink2URL: N.A.; ComponentLink2Description: Supplier link; Digikey Part Number: 401-2012-1-ND; LCSC: C92658
U10 = SMF05C.TCT: TVS DIODE 5VWM 12.5VC SC70-6; Manufacturer: Semtech; Direction: Unidirectional; Capacitance: 130pF; Reverse Breakdown Voltage: 6V; Number of Elements: 5; Element Configuration: Common Anode; Reverse Standoff Voltage: 5V; Clamping Voltage: 12.5V; Peak Pulse Power: 100W; Power Line Protection: No; Leakage Current: 5uA; Peak Pulse Current: 8A; Test Current: 1mA; ESD Protection: Yes; Diode Type: ZENER; Supplier 1: Digi-Key; Supplier Part Number 1: SMF05CCT-ND; Manufacturer Part Number: SMF05C.TCT; RoHS: Yes; Category: TVS Diodes; Stock 1: 164885; Pricing 1: 1=0.79000, 10=0.69300, 100=0.53130, 500=0.42000, 1000=0.33600 (USD); Mount: Surface Mount; Case/Package: SC; Number of Pins: 6; Min Operating Temperature: -55°C; Max Operating Temperature: 125°C; Packaging: Tape and Reel; Number of Channels: 5; Number of Unidirectional Channels: 5; Min Breakdown Voltage: 6V; Working Voltage: 5V; Polarity: Unidirectional; Max Reverse Leakage Current: 5uA; Max Breakdown Voltage: 6V; Voltage Rating (DC): 5V; Operating Supply Voltage: 5V; Resistor Type: Zener; Series: SMF; Clamping Voltage-Max: 12.5V; Length: 2mm; Width: 1.25mm; Height: 0.9mm; Depth: 1.25mm; Radiation Hardening: No; Lead Free: Lead Free; RoHS Compliant: Yes; ComponentLink1URL: https://datasheet.ciiva.com/338/smf05c-338385.pdf?src-supplier=Digi-Key; ComponentLink1Description: https://datasheet.ciiva.com/338/smf05c-338385.pdf?src-supplier=Digi-Key; ComponentLink2URL: https://datasheet.ciiva.com/18065/getdatasheetpartid-89007-18065142.pdf?src-supplier=Verical; ComponentLink2Description: https://datasheet.ciiva.com/18065/getdatasheetpartid-89007-18065142.pdf?src-supplier=Verical; ComponentLink3URL: https://datasheet.ciiva.com/338/smf05c-338386.pdf?src-supplier=Digi-Key; ComponentLink3Description: https://datasheet.ciiva.com/338/smf05c-338386.pdf?src-supplier=Digi-Key; ComponentLink4URL: https://datasheet.ciiva.com/338/smf05c-338387.pdf?src-supplier=Digi-Key; ComponentLink4Description: https://datasheet.ciiva.com/338/smf05c-338387.pdf?src-supplier=Digi-Key; ComponentLink5URL: https://datasheet.ciiva.com/16387/smf05c-16387308.pdf?src-supplier=Future+Electronics; ComponentLink5Description: https://datasheet.ciiva.com/16387/smf05c-16387308.pdf?src-supplier=Future+Electronics; LCSC: C85191
U11 = FSA2466UMX: Data / Audio Low-Voltage Dual DPDT Analog Switch; Manufacturer: ON Semiconductor; Part number IPS: 00000009986; Note: N.A.; Artikkelnr Noca: 15070069; Pad Count: 16; Part Number: FSA2466UMX; Manufacturer Part Number: FSA2466UMX; ComponentLink1URL: N.A.; ComponentLink1Description: Datasheet; ComponentLink2URL: N.A.; ComponentLink2Description: Supplier link; HelpURL: https://www.onsemi.com/pub/Collateral/FSA2466-D.PDF; Footprint Doc: UFQFN-16; LatestRevisionDate: 2019-05-15; Published: 2016-05-18; Value: FSA2466UMX; Supplier 1: Digi-Key; Supplier Part Number 1: FSA2466UMXCT-ND; Supplier 2: Mouser; Supplier Part Number 2: 512-FSA2466UMX; Component Class: Misc_ICs; PartId: 101900422; LCSC: C457657

## Sheet 3.MCU NRF52840.SchDoc: Thingy:91 nRF52840 MCU
size A3; Organization: Nordic Semiconductor; DocumentNumber: 3; SheetNumber: 3; SheetTotal: 6; CompanyName: Nordic Semiconductor; DocumentSize: A3; ProjectName: Gear Trak.PrjPcb
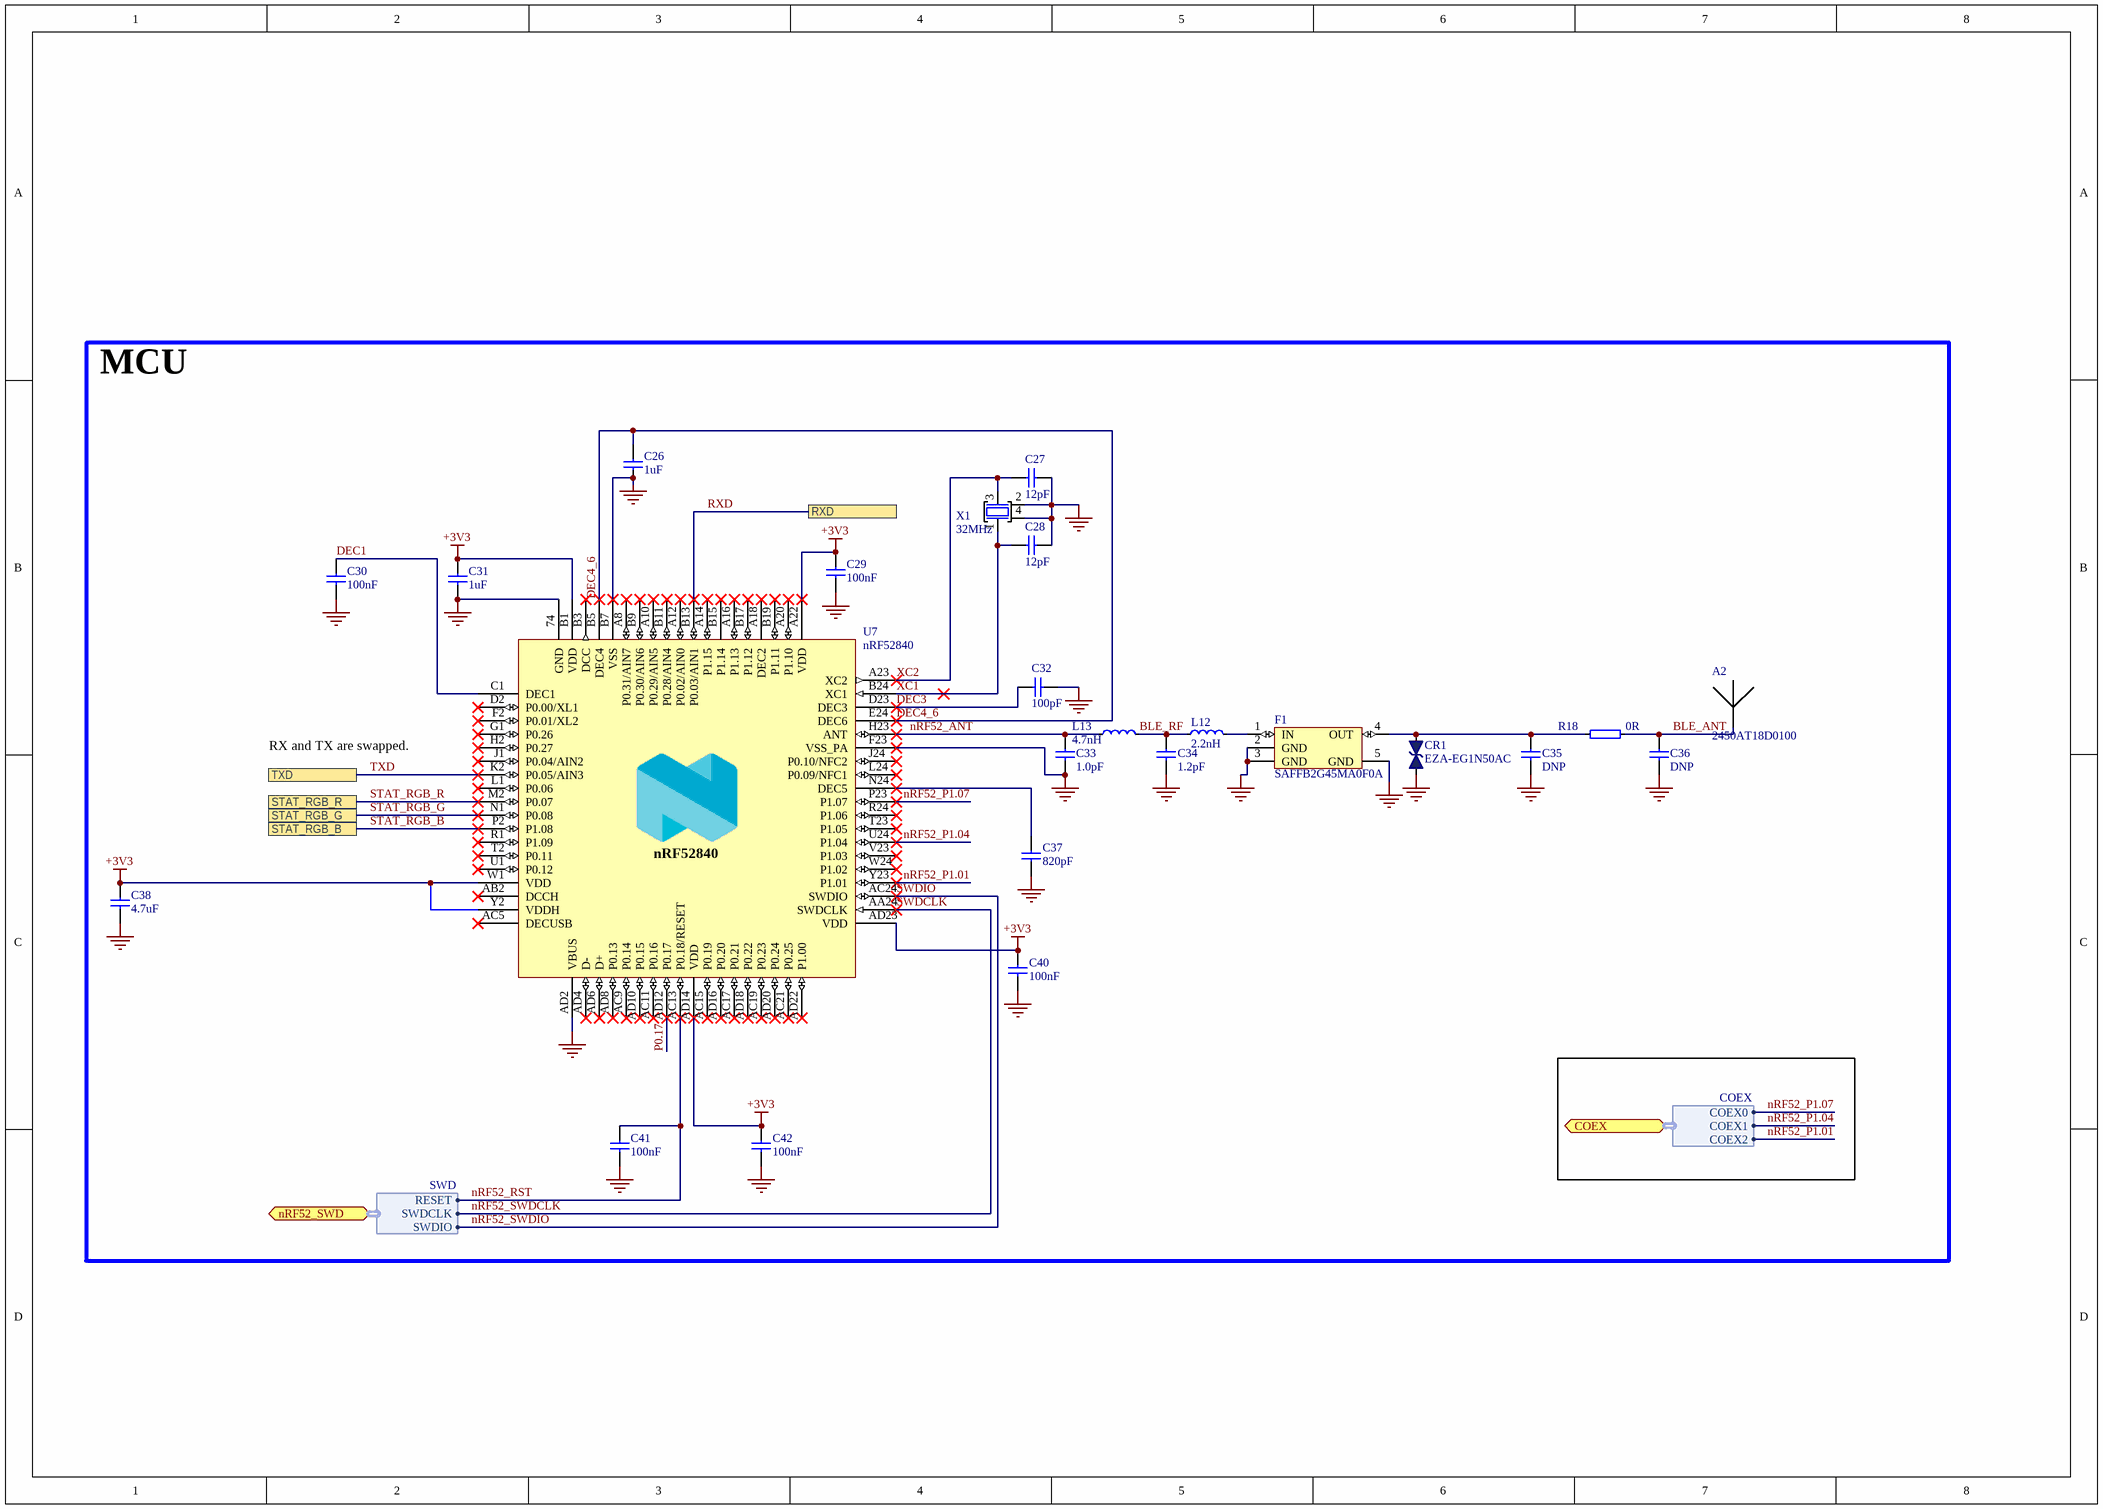
[diagram p6: 3.MCU NRF52840.SchDoc]

### Parts
A2  2450AT18D0100  [2450AT18D0100_STD-R]
C26  1uF  [CAPC1005X04L]
C27  12pF  [CAPC1005X04L]
C28  12pF  [CAPC1005X04L]
C29  100nF  [CAPC1005X04L]
C30  100nF  [CAPC1005X04L]
C31  1uF  [CAPC1005X04L]
C32  100pF  [CAPC1005X04L]
C33  1.0pF  [CAPC0603X03L_C]
C34  1.2pF  [CAPC0603X03L_C]
C35  DNP  [CAPC0603X03L_C]
C36  DNP  [CAPC0603X03L_C]
C37  820pF  [CAPC1005X04L]
C38  4.7uF  [CAPC1005X04L]
C40  100nF  [CAPC1005X04L]
C41  100nF  [CAPC1005X04L]
C42  100nF  [CAPC1005X04L]
CR1  EZA-EG1N50AC  [RESC0603X03L_C]
F1  SAFFB2G45MA0F0A  [SAFFB2G45MA0F0A]
L12  2.2nH  [INDC0603X03L_C]
L13  4.7nH  [INDC0603X03L_C]
R18  0R  [RESC0603X03L_C]
U7  nRF52840  [AQFN50P700X700X85_HS-74N]
X1  32MHz  [BT-XTAL_2016]

### Ports
COEX (bidir, harness COEX), nRF52_SWD (bidir, harness SWD), RXD, STAT_RGB_B, STAT_RGB_G, STAT_RGB_R, TXD

### Harnesses
COEX: COEX2, COEX1, COEX0
SWD: SWDIO, SWDCLK, RESET

### Nets
+3V3: C29.1 C31.1 C38.1 C40.1 C42.1 U7.A22(VDD) U7.AD14(VDD) U7.AD23(VDD) U7.B1(VDD) U7.W1(VDD) U7.Y2(VDDH)
GND: A2.2(GND) C26.2 C27.2 C28.2 C29.2 C30.2 C31.2 C32.2 C33.1 C34.1 C35.1 C36.1 C37.2 C38.2 C40.2 C41.2 C42.2 CR1.1 F1.2(GND) F1.3(GND) F1.5(GND) U7.74(GND) U7.AD2(VBUS) U7.B7(VSS) U7.F23(VSS_PA) X1.2(GND) X1.4(GND)
BLE_ANT: A2.1 C36.2 R18.2
BLE_RF: C34.2 L12.1 L13.2
DEC1: C30.1 U7.C1(DEC1)
DEC3: C32.1 U7.D23(DEC3)
DEC4_6: C26.1 U7.B5(DEC4) U7.E24(DEC6)
nRF52_ANT: C33.2 L13.1 U7.H23(ANT)
nRF52_P1.01: U7.Y23(P1.01) ; port COEX.COEX2  [project net COEX2]
nRF52_P1.04: U7.U24(P1.04) ; port COEX.COEX1  [project net COEX1]
nRF52_P1.07: U7.P23(P1.07) ; port COEX.COEX0  [project net COEX0]
nRF52_RST: C41.1 U7.AC13(P0.18/RESET) ; port nRF52_SWD.RESET
nRF52_SWDCLK: U7.AA24(SWDCLK) ; port nRF52_SWD.SWDCLK  [also labelled SWDCLK]
nRF52_SWDIO: U7.AC24(SWDIO) ; port nRF52_SWD.SWDIO  [also labelled SWDIO]
P0.17: U7.AD12(P0.17)
RXD: U7.B13(P0.03/AIN1) ; port RXD
STAT_RGB_B: U7.P2(P1.08) ; port STAT_RGB_B
STAT_RGB_G: U7.N1(P0.08) ; port STAT_RGB_G
STAT_RGB_R: U7.M2(P0.07) ; port STAT_RGB_R
TXD: U7.K2(P0.05/AIN3) ; port TXD
XC1: C28.1 U7.B24(XC1) X1.1(IN)
XC2: C27.1 U7.A23(XC2) X1.3(OUT)
NetC35_2: C35.2 CR1.2 F1.4(OUT) R18.1
NetC37_1: C37.1 U7.N24(DEC5)
NetF1_1: F1.1(IN) L12.2

Not connected (* = marked no-connect by the designer): U7 A8(P0.31/AIN7)* A10(P0.29/AIN5)* A12(P0.02/AIN0)* A14(P1.15)* A16(P1.13)* A18(DEC2)* A20(P1.10)* AB2(DCCH)* AC5(DECUSB)* AC9(P0.14)* AC11(P0.16)* AC15(P0.19)* AC17(P0.21)* AC19(P0.23)* AC21(P0.25)* AD4(D-)* AD6(D+)* AD8(P0.13)* AD10(P0.15)* AD16(P0.20)* AD18(P0.22)* AD20(P0.24)* AD22(P1.00)* B3(DCC)* B9(P0.30/AIN6)* B11(P0.28/AIN4)* B15(P1.14)* B17(P1.12)* B19(P1.11)* D2(P0.00/XL1)* F2(P0.01/XL2)* G1(P0.26)* H2(P0.27)* J1(P0.04/AIN2)* J24(P0.10/NFC2)* L1(P0.06)* L24(P0.09/NFC1)* R1(P1.09)* R24(P1.06)* T2(P0.11)* T23(P1.05)* U1(P0.12)* V23(P1.03)* W24(P1.02)*

### Notes on the sheet
- MCU
- RX and TX are swapped.
- Size
- Date:
- A3
- Project Number
- Sheet         of
- Revision
- File:
- Drawn By:

### Library data of the parts
A2 = Johanson 2450AT18D0100_STD-R: 2.45 GHz chip antenna; Manufacturer: Johanson Technology; Part number IPS: 00000001415; Note: N.A.; Artikkelnr Noca: 53059035; Pad Count: 4; Part Number: Johanson 2450AT18D0100_STD-R; Manufacturer Part Number: 2450AT18D0100; Footprint Doc: 2450AT18D0100; LatestRevisionDate: 2016-06-02; Published: 2016-01-12; Value: 2450AT18D0100; ComponentLink1URL: N.A.; ComponentLink1Description: Datasheet; ComponentLink2URL: N.A.; ComponentLink2Description: Supplier link; HelpURL: http://www.johansontechnology.com/datasheets/antennas/2450AT18D0100.pdf; Supplier 1: Digi-Key; Digikey Part Number: 712-2450AT18D0100001ECT-ND; Supplier 2: Mouser; Supplier Part Number 2: 609-2450AT18D0100E; Component Class: Antennas; PartId: 100700005; LCSC: Non Stock
C26-C32 C37 C38 C40-C42 = C0402-1µ0: Capacitor, X5R, ±5%, 6.3V; ComponentLink1URL: N.A.; ComponentLink1Description: Datasheet; ComponentLink2URL: N.A.; ComponentLink2Description: Supplier link; Package: 0402
  C26 C31: LCSC: C52923
  C27 C28: LCSC: C482487
  C29 C30 C40-C42: LCSC: C513772
  C32: LCSC: C5120795
  C37: LCSC: C565563
  C38: LCSC: C274416
C33 = C0201-1.0p: Capacitor, NP0, ±0.05pF, 50V; Manufacturer: N.A.; Part number IPS: 00000001247; Pad Count: 2; Part Number: C0201-1.0p; Manufacturer Part Number: N.A.; LatestRevisionDate: 2018-10-22; Published: 2014-11-13; Value: 1.0pF; Footprint Doc: 0201; ComponentLink1URL: N.A.; ComponentLink1Description: Datasheet; ComponentLink2URL: N.A.; ComponentLink2Description: Supplier link; HelpURL: N.A.; Note: 50V; Supplier 1: N.A.; Supplier Part Number 1: N.A.; Supplier 2: N.A.; Supplier Part Number 2: N.A.; Artikkelnr Noca: N.A.; Component Class: Capacitors; PartId: 100200014; LCSC: C88903
C34 = C0201-1.0p: Capacitor, NP0, ±0.05pF, 50V; Manufacturer: N.A.; Part number IPS: 00000001247; Value: 1.0pF; Pad Count: 2; Part Number: C0201-1.0p; Manufacturer Part Number: N.A.; LatestRevisionDate: 2018-10-22; Published: 2014-11-13; Footprint Doc: 0201; ComponentLink1URL: N.A.; ComponentLink1Description: Datasheet; ComponentLink2URL: N.A.; ComponentLink2Description: Supplier link; HelpURL: N.A.; Note: 50V; Supplier 1: N.A.; Supplier Part Number 1: N.A.; Supplier 2: N.A.; Supplier Part Number 2: N.A.; Artikkelnr Noca: N.A.; Component Class: Capacitors; PartId: 100200014; LCSC: C1551
C35 C36 = C0201-0.7p-HQ-Murata: Ceramic Capacitor C0G, NP0 0201, ±0.1pF 25V; ComponentLink1URL: https://search.murata.co.jp/Ceramy/image/img/A01X/G101/ENG/GJM0335C1ER70BB01-01.pdf; ComponentLink1Description: Datasheet; ComponentLink2URL: https://www.murata.com/en-eu/products/productdetail?partno=GJM0335C1ER70BB01%23; ComponentLink2Description: Supplier link; LCSC: NILL
  C35: Package: 0402
  C36: Package: 0201
CR1 = EZA-EG1N50AC: ESD Suppressor, 30V, 0.04pF; Manufacturer: Panasonic; Part number IPS: 00000004437; Note: N.A.; Pad Count: 2; Part Number: EZA-EG1N50AC; Manufacturer Part Number: EZA-EG1N50AC; ComponentLink1URL: https://industrial.panasonic.com/cdbs/www-data/pdf/AWD0000/AWD0000C13.pdf; ComponentLink1Description: Datasheet; ComponentLink2URL: N.A.; ComponentLink2Description: Supplier link; HelpURL: N.A.; Footprint Doc: 0201; LatestRevisionDate: 2020-04-28; Published: 2020-02-06; Value: EZA-EG1N50AC; Artikkelnr Noca: N.A.; Supplier 1: Digi-Key; Digikey Part Number: P122037CT-ND; Supplier 2: N.A.; Supplier Part Number 2: N.A.; Component Class: Semiconductors; PartId: 101300173; LCSC: Not Available
F1 = SAFFB2G45MA0F0A: 2.4 GHz BPF; Manufacturer: Murata; Part number IPS: 00000001784, 80000001660; Artikkelnr Noca: N.A.; Pad Count: 5; Part Number: SAFFB2G45MA0F0A; Manufacturer Part Number: SAFFB2G45MA0F0A; ComponentLink1URL: N.A.; ComponentLink1Description: Datasheet; ComponentLink2URL: N.A.; ComponentLink2Description: Supplier link; HelpURL: N.A.; Footprint Doc: 1109; LatestRevisionDate: 2018-05-15; Published: 2018-05-15; Value: SAFFB2G45MA0F0A; Supplier 1: N.A.; Supplier Part Number 1: N.A.; Supplier 2: N.A.; Supplier Part Number 2: N.A.; Component Class: Filters; PartId: 100800023; Note: N.A.; LCSC: C910680
L12 = L0201-3n9: Inductor, 400mA, ±0.1nH; Manufacturer: Murata; Manufacturer Part Number: LQP03TN3N9B02D; Part number IPS: 00000001253; Value: 3.9nH; Note: N.A.; Pad Count: 2; Part Number: L0201-3n9; LatestRevisionDate: 2017-11-09; Published: 2013-04-10; Footprint Doc: 0201; ComponentLink1URL: N.A.; ComponentLink1Description: Datasheet; ComponentLink2URL: N.A.; ComponentLink2Description: Supplier link; HelpURL: N.A.; Supplier 1: N.A.; Supplier Part Number 1: N.A.; Supplier 2: N.A.; Supplier Part Number 2: N.A.; Artikkelnr Noca: N.A.; Component Class: Inductors; PartId: 100300022; LCSC: C90191
L13 = L0201-4n7: Inductor, 350mA, ±3%; Package: 0201; ComponentLink1Description: Datasheet; ComponentLink2Description: Supplier link; ComponentLink1URL: N.A.; ComponentLink2URL: N.A.; LCSC: C86126
R18 = R0201-2R2: Resistor, ±1%, 0.05W; ComponentLink1URL: N.A.; ComponentLink1Description: Datasheet; ComponentLink2URL: N.A.; ComponentLink2Description: Supplier link; Package: 0201; LCSC: C100147
U7 = nRF52840: AQFN-73-EP(7x7) RF Transceiver ICs ROHS; LCSC: C190794; Package: QFN-73
X1 = XTAL_SMD2016_32MHz_8pF_Murata: XTAL SMD 2016, 32MHz, Cl=8pF, Tol: ±10ppm, Stab: ±10ppm; ComponentLink1Description: Datasheet; ComponentLink1URL: N.A.; ComponentLink2Description: Supplier link; ComponentLink2URL: N.A.; Package: SMD-2016; LCSC: C2965582

## Nets that join several sheets
+3V3: 2.Microcontroller-NRF9160 (11 pins), 5.RGB (LED1.4), 4.Power Source (7 pins), 6.Connectors (C60.1 P1.1 U11.14), 3.MCU NRF52840 (11 pins)
GND: 2.Microcontroller-NRF9160 (75 pins), 5.RGB (6 pins), 4.Power Source (33 pins), 6.Connectors (13 pins), 3.MCU NRF52840 (27 pins)
COEX0: 2.Microcontroller-NRF9160 (R3.2 U3.6 U4.93), 3.MCU NRF52840 (U7.P23)
COEX1: 2.Microcontroller-NRF9160 (U4.92), 3.MCU NRF52840 (U7.U24)
COEX2: 2.Microcontroller-NRF9160 (U4.91), 4.Power Source (R34.2 U9.B2), 3.MCU NRF52840 (U7.Y23)
DETECT: 2.Microcontroller-NRF9160 (U4.45), 6.Connectors (J5.CD U10.3)
NetR13_1: 2.Microcontroller-NRF9160 (R13.1), 6.Connectors (U11.7)
NetU4_33: 2.Microcontroller-NRF9160 (U4.33), 6.Connectors (U11.3)
NetU4_34: 2.Microcontroller-NRF9160 (U4.34), 6.Connectors (U11.15)
nRF52_RST: 6.Connectors (U11.9), 3.MCU NRF52840 (C41.1 U7.AC13)
nRF52_SWDCLK: 6.Connectors (U11.5), 3.MCU NRF52840 (U7.AA24)
nRF52_SWDIO: 6.Connectors (U11.1), 3.MCU NRF52840 (U7.AC24)
RXD: 2.Microcontroller-NRF9160 (U4.86), 3.MCU NRF52840 (U7.B13)
SIM_1V8: 2.Microcontroller-NRF9160 (U4.49), 6.Connectors (C59.2 J5.C1 U10.1)
SIM_CLK: 2.Microcontroller-NRF9160 (U4.46), 6.Connectors (J5.C3 U10.4)
SIM_IO: 2.Microcontroller-NRF9160 (U4.48), 6.Connectors (J5.C7 U10.5)
SIM_RST: 2.Microcontroller-NRF9160 (U4.43), 6.Connectors (J5.C2 U10.6)
STAT_RGB_B: 5.RGB (Q3.1 R24.2), 3.MCU NRF52840 (U7.P2)
STAT_RGB_G: 5.RGB (Q2.1 R23.2), 3.MCU NRF52840 (U7.N1)
STAT_RGB_R: 5.RGB (Q1.1 R22.2), 3.MCU NRF52840 (U7.M2)
TXD: 2.Microcontroller-NRF9160 (U4.87), 3.MCU NRF52840 (U7.K2)
VDD_RF_FE: 2.Microcontroller-NRF9160 (8 pins), 4.Power Source (U9.A1)